# Altium schematic sheet CRYPTOCHIP.SchDoc: CRYPTO
size A4; Author: Silvio Navaretti; CompanyName: Arduino srl; DocumentNumber: ABX00063; Revision: V1.4; SheetNumber: 8; SheetTotal: 8; RevAuthor: Silvio Navaretti
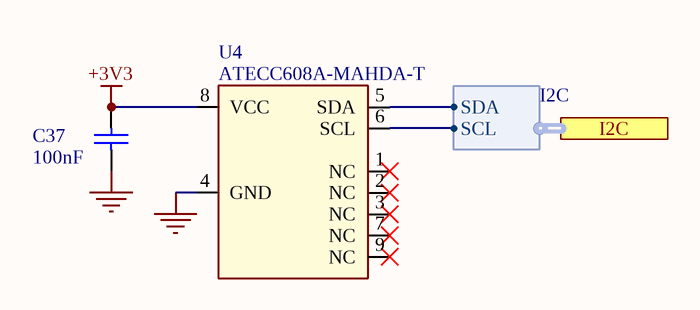
[diagram p0: CRYPTOCHIP.SchDoc]

## Parts
C37  value 100nF  [CAP-0402]  (hidden comment: GRM155R61H104KE19D)
U4  ATECC608A-MAHDA-T  [UDFN8]

## Ports
I2C (harness I2C)

## Harnesses
I2C: SDA, SCL

## Nets
+3V3: C37.2 U4.8(VCC)
GND: C37.1 U4.4(GND)
NetU4_5: U4.5(SDA) ; port I2C.SDA
NetU4_6: U4.6(SCL) ; port I2C.SCL

Not connected (* = marked no-connect by the designer): U4 1(NC)* 2(NC)* 3(NC)* 7(NC)* 9(NC)*

## Notes on the sheet
- Title:
- ID:
- Date:
- Time:
- Version:
- Sheet
- of
- RevAuthor:
- Reference Designs ARE PROVIDED "AS IS" AND "WITH ALL FAULTS. Arduino SA DISCLAIMS ALL OTHER WARRANTIES, EXPRESS OR IMPLIED, REGARDING PRODUCTS, INCLUDING BUT NOT LIMITED TO, ANY IMPLIED WARRANTIES OF MERCHANTABILITY OR FITNESS FOR A PARTICULAR PURPOSE.
  Arduino SA may make changes to specifications and product descriptions at any time, without notice. The Customer must not rely on the absence or characteristics of any features or instructions marked "reserved" or "undefined". Arduino SA reserves these for future definition and shall have no responsibility whatsoever for conflicts or incompatibilities arising from future changes to them. The product information on the Web Site or Materials is subject to change without notice.
  Do not finalize a design with this info. ARDUINO and other Arduino brands and logos and Trademarks of Arduino SA. All Arduino SA Trademarks cannot be used without owner's formal permission.
- File:
- Author:

## Library data of the parts
C37 = C0015-A.14: CAP CHIP 0402 100nF 10% 50V X5R; Manufacturer: Murata; Code Arduino: A5141; Voltage: 50V; Dielectric: X5R; Part Number: GRM155R61H104KE19D; Tolerance: 10%; Case Code (Imperial): 0402; Technology: Ceramic
U4 = U0034-A.8: IC AUTHENTICATION CHIP UDFN8; Manufacturer: Microchip; Code Arduino: U0034; Part Number: ATECC608A-MAHDA-T